# Altium project Control_Flex_Cable (26-Pin).PrjPcb
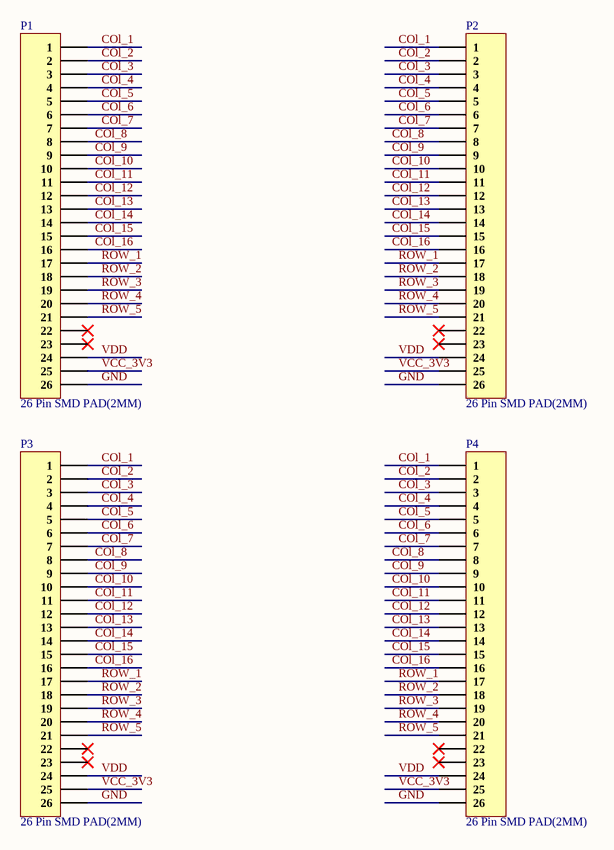
[diagram p0: Sheet1.SchDoc]
1 sheet, 4 parts. Net scope: global (net labels, ports and power ports of the same name join across sheets).
Board file: PCB_Flex_26.PcbDoc

## Sheet Sheet1.SchDoc
size A4; SheetNumber: 1; SheetTotal: 1

### Parts
P1  26 Pin SMD PAD(2MM)  [26 Pin SMD PAD(2mm)]
P2  26 Pin SMD PAD(2MM)  [26 Pin SMD PAD(2mm)]
P3  26 Pin SMD PAD(2MM)  [26 Pin SMD PAD(2mm)]
P4  26 Pin SMD PAD(2MM)  [26 Pin SMD PAD(2mm)]

### Nets
COl_1: P1.1 P2.1 P3.1 P4.1
COl_2: P1.2 P2.2 P3.2 P4.2
COl_3: P1.3 P2.3 P3.3 P4.3
COl_4: P1.4 P2.4 P3.4 P4.4
COl_5: P1.5 P2.5 P3.5 P4.5
COl_6: P1.6 P2.6 P3.6 P4.6
COl_7: P1.7 P2.7 P3.7 P4.7
COl_8: P1.8 P2.8 P3.8 P4.8
COl_9: P1.9 P2.9 P3.9 P4.9
COl_10: P1.10 P2.10 P3.10 P4.10
COl_11: P1.11 P2.11 P3.11 P4.11
COl_12: P1.12 P2.12 P3.12 P4.12
COl_13: P1.13 P2.13 P3.13 P4.13
COl_14: P1.14 P2.14 P3.14 P4.14
COl_15: P1.15 P2.15 P3.15 P4.15
COl_16: P1.16 P2.16 P3.16 P4.16
GND: P1.26 P2.26 P3.26 P4.26
ROW_1: P1.17 P2.17 P3.17 P4.17
ROW_2: P1.18 P2.18 P3.18 P4.18
ROW_3: P1.19 P2.19 P3.19 P4.19
ROW_4: P1.20 P2.20 P3.20 P4.20
ROW_5: P1.21 P2.21 P3.21 P4.21
VCC_3V3: P1.25 P2.25 P3.25 P4.25
VDD: P1.24 P2.24 P3.24 P4.24

Not connected (* = marked no-connect by the designer): P1 22* 23*; P2 22* 23*; P3 22* 23*; P4 22* 23*

### Library data of the parts
P1-P4 = 26 Pin SMD PAD(2MM): Ribbon Wire Connecting PADs, Length 1.6mm.